# EasyEDA Pro project 集成板.eprj, board 指示面板3.1(国赛)
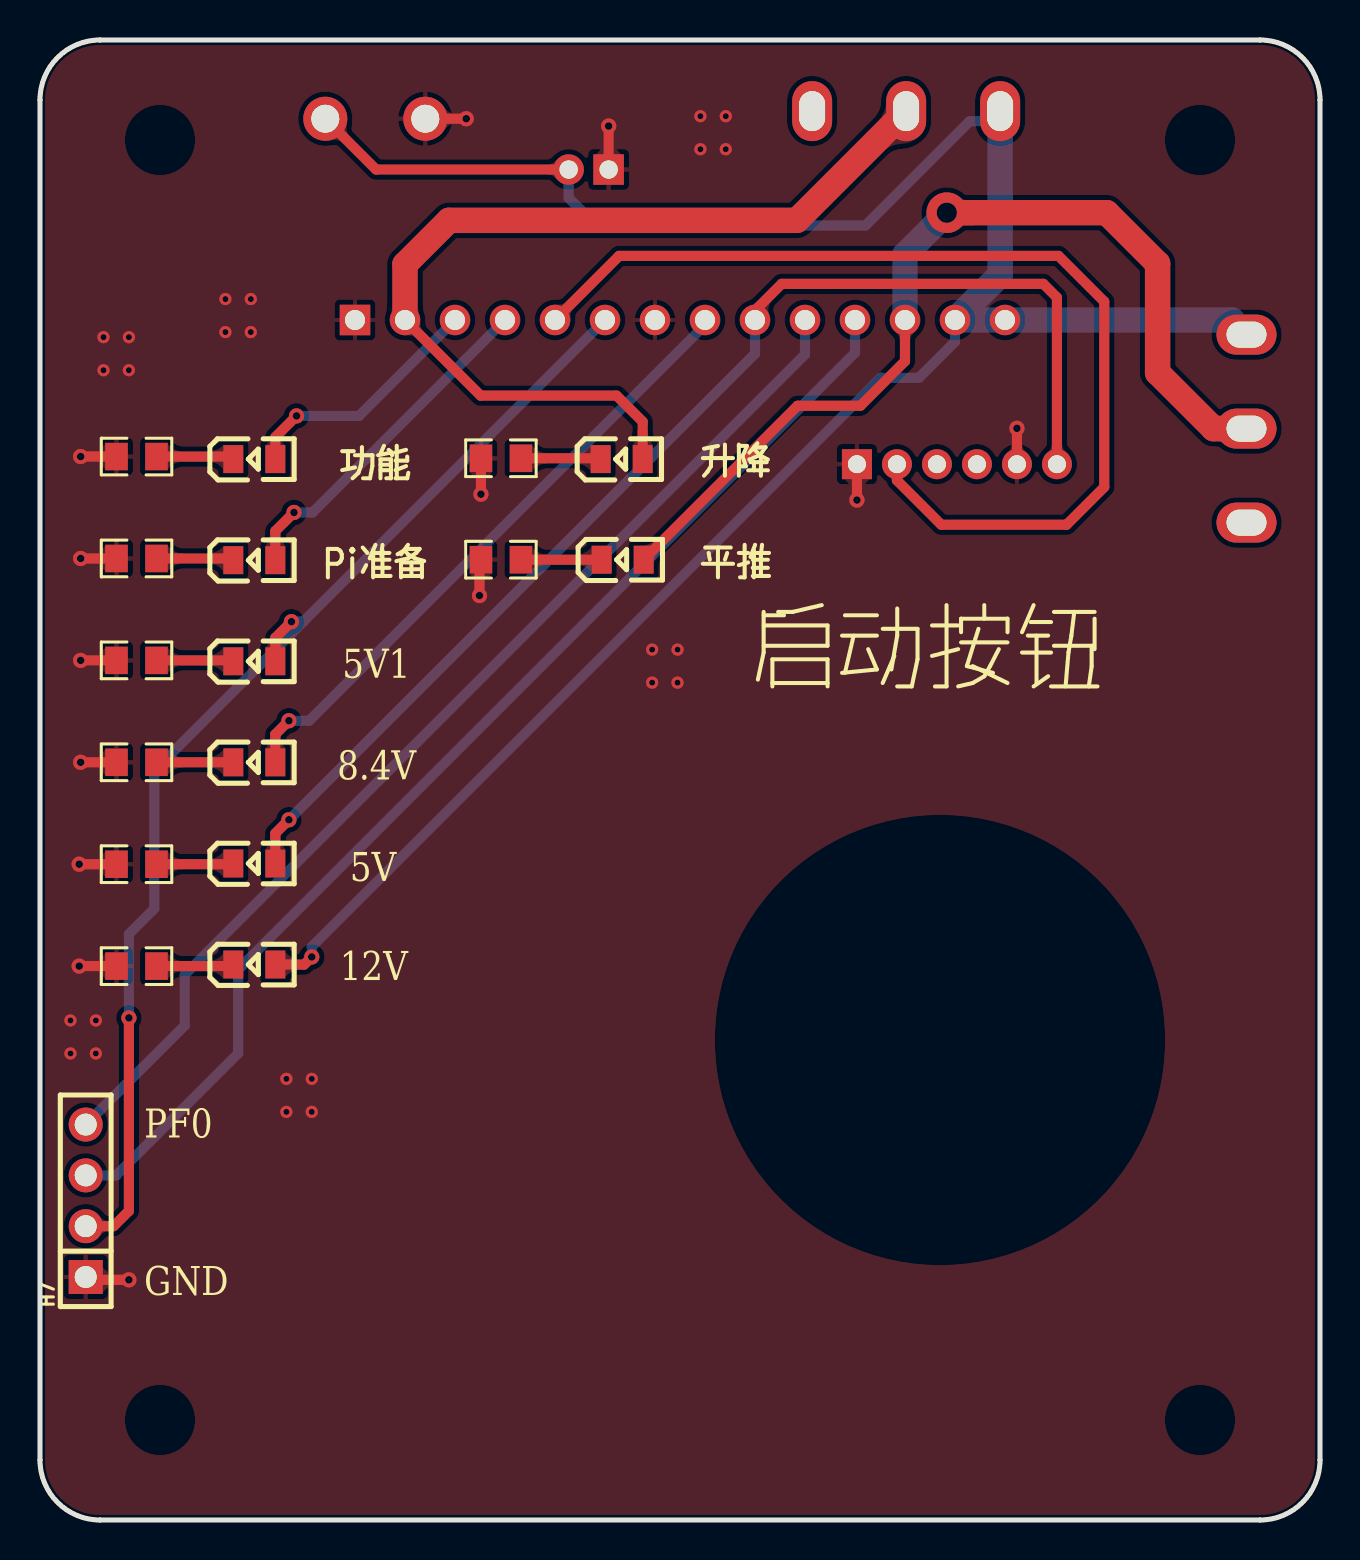
[diagram p12: board, top side]
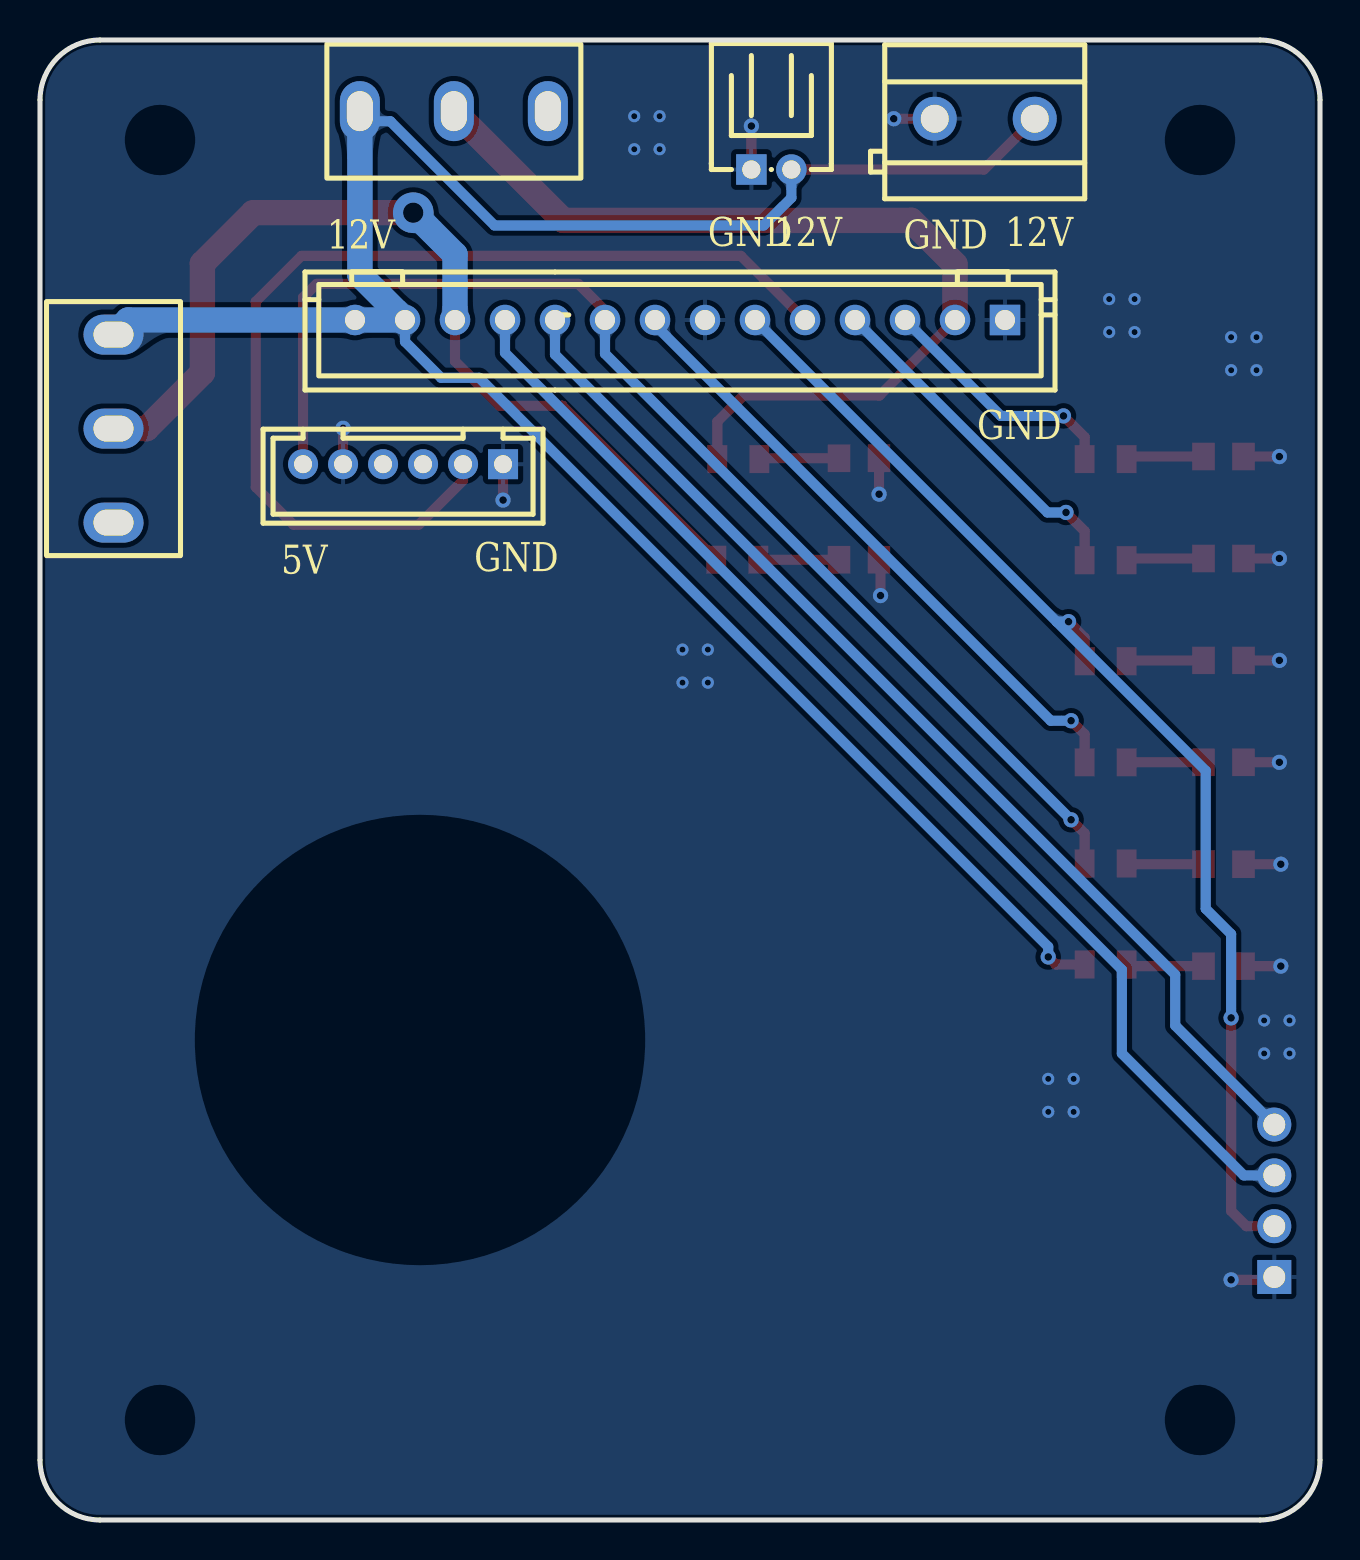
[diagram p13: board, bottom side, seen from below]

Outline 64 x 74 mm; copper layers: Top Layer, Bottom Layer. Coordinates in mm from the lower left corner of the outline.
Outline path: 0,71 0,3 arc(0.88,0.88) 3,0 61,0 arc(63.12,0.88) 64,3 64,71 arc(63.12,73.12) 61,74 3,74 arc(0.88,73.12) 0,71
Stack: Top Layer 0.035mm / Dielectric1 1.51mm FR4 er 4.5 / Bottom Layer 0.035mm

## Design rules (mm)
template: JLCPCB Capability(Two Layers Board)
spacing copperThickness1oz (default): track to track 0.102, other pairs 0.152 to 0.3
spacing copperThickness2oz: track to track 0.203, other pairs 0.152 to 0.3
track width copperThickness1oz (default): min 0.127, default 0.254, max 2.54
track width copperThickness2oz: min 0.203, default 0.254, max 2.54
differential pair differentialPair (default): width min 0.127, default 0.254, max 2.54; gap min 0.152, default 0.152
via viaSize (default): diameter min 0.5, default 0.61, max 10; hole min 0.3, default 0.305, max 6.3

## Placement (name value [footprint] x y rotation side)
CN10  PH-6A  [CONN-TH_6P-P2.00_PH-6A_C2908627]  45.85 52.79 0 bottom
CN11  ZX-XH2.54-14PZZ  [CONN-TH_14P-P2.50_ZX-XH2.54-14PZZ]  32 60 0 bottom
H7  2.54-1*4P母  [HDR-TH_4P-P2.54-V-F]  2.29 15.96 90 top
LED4  NCD0805G1  [LED0805-R-RD]  10.72 32.83 0 top
LED5  NCD0805G1  [LED0805-R-RD]  10.72 37.88 0 top
LED7  NCD0805G1  [LED0805-R-RD]  10.72 27.77 0 top
LED8  NCD0805G1  [LED0805-R-RD]  29.08 53.05 0 top
LED9  NCD0805G1  [LED0805-R-RD]  10.72 47.99 0 top
LED10  NCD0805G1  [LED0805-R-RD]  10.72 42.94 0 top
LED11  NCD0805G1  [LED0805-R-RD]  10.72 53.05 0 top
LED12  NCD0805G1  [LED0805-R-RD]  29.13 48.02 0 top
R7  3kΩ  [R0805]  4.83 27.69 0 top
R8  3kΩ  [R0805]  4.83 37.89 0 top
R9  3kΩ  [R0805]  4.83 32.79 0 top
R10  3kΩ  [R0805]  23.05 53.09 0 top
R11  3kΩ  [R0805]  4.83 48.08 0 top
R12  3kΩ  [R0805]  4.83 42.98 0 top
R13  3kΩ  [R0805]  4.83 53.17 0 top
R14  3kΩ  [R0805]  23.05 48.02 0 top
SW1  SS-12D10L5  [SW-TH_SS-12D10L5]  43.31 70.44 180 bottom
SW2  SS-12D10L5  [SW-TH_SS-12D10L5]  60.32 54.57 270 bottom
U15  KF301-5.0-2P  [CONN-TH_P5.00_KF301-5.0-2P]  16.76 70.06 0 bottom
U20  WAFER-PH2.0-2PWZ  [CONN-TH_2P-P2.00_GP01-2001WR-2P]  27.43 67.52 180 bottom

## Footprints (pads in the part's own frame, mm; a bottom-side part is the same pattern mirrored in y, then rotated)
CONN-TH_2P-P2.00_GP01-2001WR-2P
  rect 1.524x1.524 hole 0.914: 1(-1,0)
  round 1.524 hole 0.914: 2(1,0)
CONN-TH_6P-P2.00_PH-6A_C2908627
  rect 1.5x1.5 hole 0.9: 1(-5,0)
  round 1.5 hole 0.9: 2(-3,0) 3(-1,0) 4(1,0) 5(3,0) 6(5,0)
CONN-TH_14P-P2.50_ZX-XH2.54-14PZZ
  rect 1.524x1.524 hole 1: 1(-16.25,0)
  round 1.524 hole 1: 2(-13.75,0) 3(-11.25,0) 4(-8.75,0) 5(-6.25,0) 6(-3.75,0) 7(-1.25,0) 8(1.25,0) 9(3.75,0) 10(6.25,0) 11(8.75,0) 12(11.25,0) 13(13.75,0) 14(16.25,0)
CONN-TH_P5.00_KF301-5.0-2P
  round 2.2 hole 1.4: 1(-2.5,0) 2(2.5,0)
HDR-TH_4P-P2.54-V-F
  rect 1.7x1.7 hole 1.1: 1(-3.81,0)
  round 1.7 hole 1.1: 2(-1.27,0) 3(1.27,0) 4(3.81,0)
LED0805-R-RD
  rect 1x1.399 smd: 1(1.05,0) 2(-1.05,0)
R0805
  rect 1.133x1.377 smd: 1(-1,0) 2(1,0)
SW-TH_SS-12D10L5
  oval 2x3 hole 1.3x2: 1(-4.7,0) 2(0,0) 3(4.7,0)

## Nets
As in the schematic.

## Via types
v1: diameter 0.762, hole 0.381, Top Layer to Bottom Layer, 20 vias
v2: diameter 0.61, hole 0.305, Top Layer to Bottom Layer, 24 vias
v3: diameter 2.032, hole 1.016, Top Layer to Bottom Layer, 1 via

## Routing (per net, layer and track width the routed paths; a pad name or vN(x,y) marks a point on that pad's centre or on a via; arc(x,y) is an arc through that point)
5V: length 61.8
  Top Layer w0.508: CN10.6 50.85,61.13 50.16,61.81 37.08,61.81 35.75,60.47 CN11.9 ; v1(12.45,35.01) 11.77,34.33 11.77,32.83
  Bottom Layer w0.508: v1(12.45,35.01) 35.75,58.31 CN11.9
5V1: length 59.8
  Top Layer w0.508: 11.77,42.94 11.77,44.11 v1(12.57,44.92) ; v1(4.44,25.11) 4.44,15.45 3.68,14.69 H7.2
  Bottom Layer w0.508: 13.17,44.92 CN11.6 ; 13.17,44.92 5.72,37.47 5.72,30.57 4.44,29.3 v1(4.44,25.11) ; 13.17,44.92 v1(12.57,44.92)
8.4V: length 31.6
  Top Layer w0.508: v1(12.45,39.96) 11.77,39.28 11.77,37.88
  Bottom Layer w0.508: v1(12.45,39.96) 13.46,39.96 33.25,59.75 CN11.8
12V: length 112.9
  Top Layer w0.508: v1(13.59,28.15) 13.21,27.77 11.77,27.77 ; U20.2 16.8,67.52 U15.1
  Bottom Layer w0.508: 47.5,69.94 46.48,69.94 41.28,64.73 27.81,64.73 26.43,66.11 U20.2 ; v1(13.59,28.15) 13.59,28.66 42.04,57.11 43.94,57.11 45.75,58.92 CN11.13
  Bottom Layer w1.27: 48.01,70.44 48.01,62.26 CN11.13 CN11.14 59.59,60 SW2.1
12V5: length 46.9
  Top Layer w0.508: CN11.2 22.03,56.22 28.83,56.22 30.13,54.92 LED8.1
  Top Layer w1.27: CN11.2 18.25,62.79 20.45,64.98 37.85,64.98 SW1.2
12V6: length 48.1
  Top Layer w0.508: LED12.1 37.88,55.71 41.02,55.71 43.25,57.94 CN11.12
  Top Layer w1.27: SW2.2 58.67,54.57 55.88,57.36 55.88,62.82 53.34,65.36 v3(45.34,65.36)
  Bottom Layer w1.27: v3(45.34,65.36) 43.25,63.28 CN11.12
GND: length 24.4
  Top Layer w0.508: H7.1 2.43,12.01 v1(4.44,12.01) ; R12.1 v1(2.03,42.98) ; 3.75,27.69 v1(1.96,27.69) ; R8.1 v1(2.03,37.89) ; U20.1 v1(28.43,69.7) ; R13.1 v1(2.03,53.17) ; R11.1 v1(2.03,48.08) ; 21.97,48.02 v1(21.97,46.22) ; R10.1 v1(22.05,51.29) ; U15.2 v1(21.31,70.06) ; 3.75,32.79 v1(1.96,32.79) ; CN10.1 v1(40.85,51) ; CN10.5 v1(48.85,54.58)
  vias: v2(1.52,24.98) v2(1.52,23.33) v2(2.79,24.98) v2(2.79,23.33) v2(3.17,59.14) v2(3.17,57.49) v2(4.44,59.14) v2(4.44,57.49) v2(9.27,61.05) v2(9.27,59.39) v2(10.54,61.05) v2(10.54,59.39) v2(12.32,22.06) v2(12.32,20.41) v2(13.59,22.06) v2(13.59,20.41) v2(30.61,43.52) v2(30.61,41.87) v2(31.88,43.52) v2(31.87,41.87) v2(33.02,70.19) v2(33.02,68.54) v2(34.29,70.19) v2(34.29,68.54)
PA8: length 17.3
  Top Layer w0.508: 11.77,47.99 11.77,49.44 v1(12.7,50.38)
  Bottom Layer w0.508: v1(12.7,50.38) 13.63,50.38 CN11.4
PC9: length 51.9
  Top Layer w0.508: CN11.5 28.96,63.2 50.93,63.2 53.21,60.92 53.21,51.65 51.33,49.77 45.06,49.77 42.85,51.98 CN10.2
PF0: length 55.1
  Bottom Layer w0.508: H7.4 7.24,24.72 7.24,27.26 38.25,58.28 CN11.10
PF1: length 59.6
  Bottom Layer w0.508: H7.3 3.81,17.23 9.91,23.33 9.91,27.52 40.75,58.36 CN11.11
PG15: length 12.5
  Top Layer w0.508: v1(12.83,55.2) 11.77,54.14 11.77,53.05
  Bottom Layer w0.508: v1(12.83,55.2) 15.95,55.2 CN11.3
$1N1259: length 3.9
  Top Layer w0.508: LED7.2 9.59,27.69 R7.2
$1N1261: length 3.8
  Top Layer w0.508: R8.2 9.66,37.89 LED5.2
$1N1263: length 3.9
  Top Layer w0.508: LED4.2 9.63,32.79 R9.2
$1N1273: length 4
  Top Layer w0.508: LED8.2 27.99,53.09 R10.2
$1N1276: length 3.9
  Top Layer w0.508: R11.2 9.58,48.08 LED9.2
$1N1287: length 3.9
  Top Layer w0.508: R12.2 9.62,42.98 LED10.2
$1N1806: length 3.9
  Top Layer w0.508: R13.2 9.54,53.17 LED11.2
$1N1907: length 4
  Top Layer w0.508: R14.2 LED12.2

## Copper pours and planes (outline as drawn; the poured copper is in the pictures)
GND on Top Layer: -8.76,77.94 73.41,77.94 73.41,-5.76 -8.76,-5.76
GND on Top Layer: -4.83,77.68 70.23,77.68 70.23,-2.45 -4.83,-2.45
GND on Bottom Layer: -8.64,79.33 72.9,79.33 72.9,-5.88 -8.64,-5.88

Small or netless copper shapes (teardrops, artwork), in the pictures only: 70 on Top Layer, 28 on Bottom Layer

## Text on the board
Bottom Silkscreen Layer: 12V | GND | 5V
Top Silkscreen Layer: GND | PF0 | Pi准备 | 功能 | 8.4V | 12V | 5V1 | 5V | 升降 | 平推 | 启动按钮
